# EasyEDA schematic blinky_sch.json
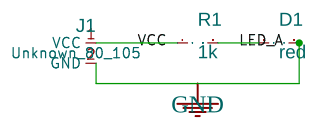
[diagram p0: schematic sheet]

## Parts
D1  red  [LED0603]
J1  -  [HDR-1x2]
R1  1k  [0603]

## Library data of the parts
R1 = -: Manufacturer Part: R0603-1K00

## Nets
GND: D1.2(K) J1.2(GND)
VCC: J1.1(VCC) R1.1
LED_A: D1.1(A) R1.2
